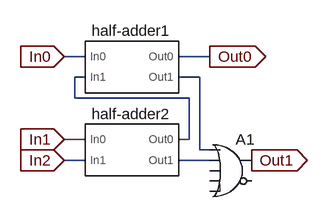
[diagram p0: schematic full-adder.asc]
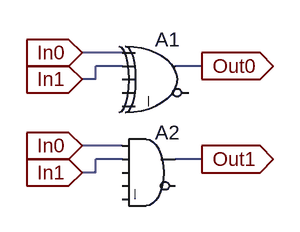
[diagram p1: sub-circuit half-adder.asc]
full-adder.asc, the LTspice schematic file:
Version 4.1
SHEET 1 880 680
WIRE 64 96 32 96
WIRE 256 96 208 96
WIRE 64 128 48 128
WIRE 240 128 208 128
WIRE 48 160 48 128
WIRE 224 160 48 160
WIRE 64 224 32 224
WIRE 224 224 224 160
WIRE 224 224 208 224
WIRE 240 240 240 128
WIRE 256 240 240 240
WIRE 64 256 32 256
WIRE 256 256 208 256
FLAG 32 96 In0
IOPIN 32 96 In
FLAG 32 224 In1
IOPIN 32 224 In
FLAG 32 256 In2
IOPIN 32 256 In
FLAG 256 96 Out0
IOPIN 256 96 Out
FLAG 320 256 Out1
IOPIN 320 256 Out
SYMBOL half-adder 128 112 R0
SYMATTR InstName half-adder1
SYMBOL half-adder 128 240 R0
SYMATTR InstName half-adder2
SYMBOL Digital\\or 288 208 R0
SYMATTR InstName A1

half-adder.asc, the sub-circuit schematic file:
Version 4.1
SHEET 1 880 680
WIRE 144 112 96 112
WIRE 144 128 112 128
WIRE 240 128 208 128
WIRE 112 144 112 128
WIRE 112 144 96 144
WIRE 144 224 96 224
WIRE 144 240 112 240
WIRE 240 240 208 240
WIRE 112 256 112 240
WIRE 112 256 96 256
FLAG 96 112 In0
IOPIN 96 112 In
FLAG 96 144 In1
IOPIN 96 144 In
FLAG 240 128 Out0
IOPIN 240 128 Out
FLAG 96 224 In0
IOPIN 96 224 In
FLAG 96 256 In1
IOPIN 96 256 In
FLAG 240 240 Out1
IOPIN 240 240 Out
SYMBOL Digital\\xor 192 80 R0
SYMATTR InstName A1
SYMBOL Digital\\and 176 192 R0
SYMATTR InstName A2

The netlist it stands for:
* full-adder.asc
X§half-adder1 In0 N001 Out0 N002 half-adder
X§half-adder2 In1 In2 N001 N003 half-adder
A1 N002 N003 0 0 0 0 Out1 0 OR

* block symbol definitions
.subckt half-adder In0 In1 Out0 Out1
A1 In0 In1 0 0 0 0 Out0 0 XOR
A2 In0 In1 0 0 0 0 Out1 0 AND
.ends half-adder

.backanno
.end